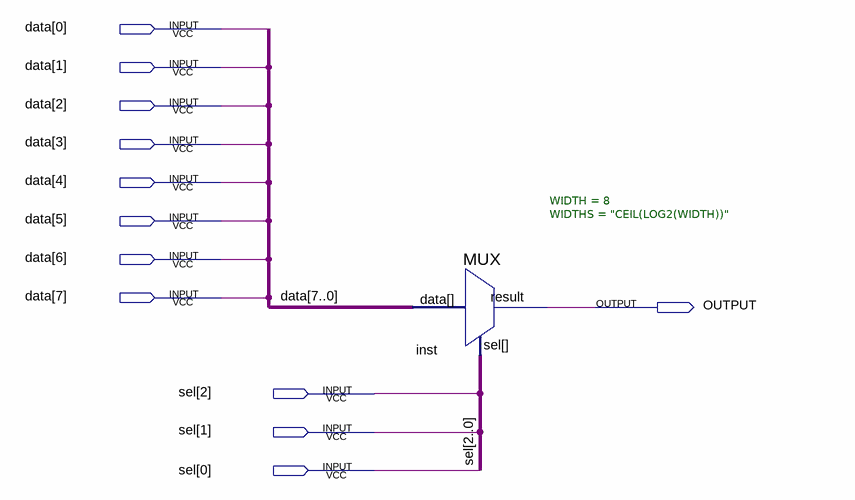
[diagram p0: schematic sheet]
// Quartus schematic 8TO1_MUX.bdf as structural Verilog: 1 symbols, 12 pins
module \8TO1_MUX  (
  input  [7:0] data,
  input  [2:0] sel,
  output OUTPUT
);

  MUX #(.WIDTH(8), .WIDTHS("CEIL(LOG2(WIDTH))")) inst (.data(data), .sel(sel), .result(OUTPUT));
endmodule
